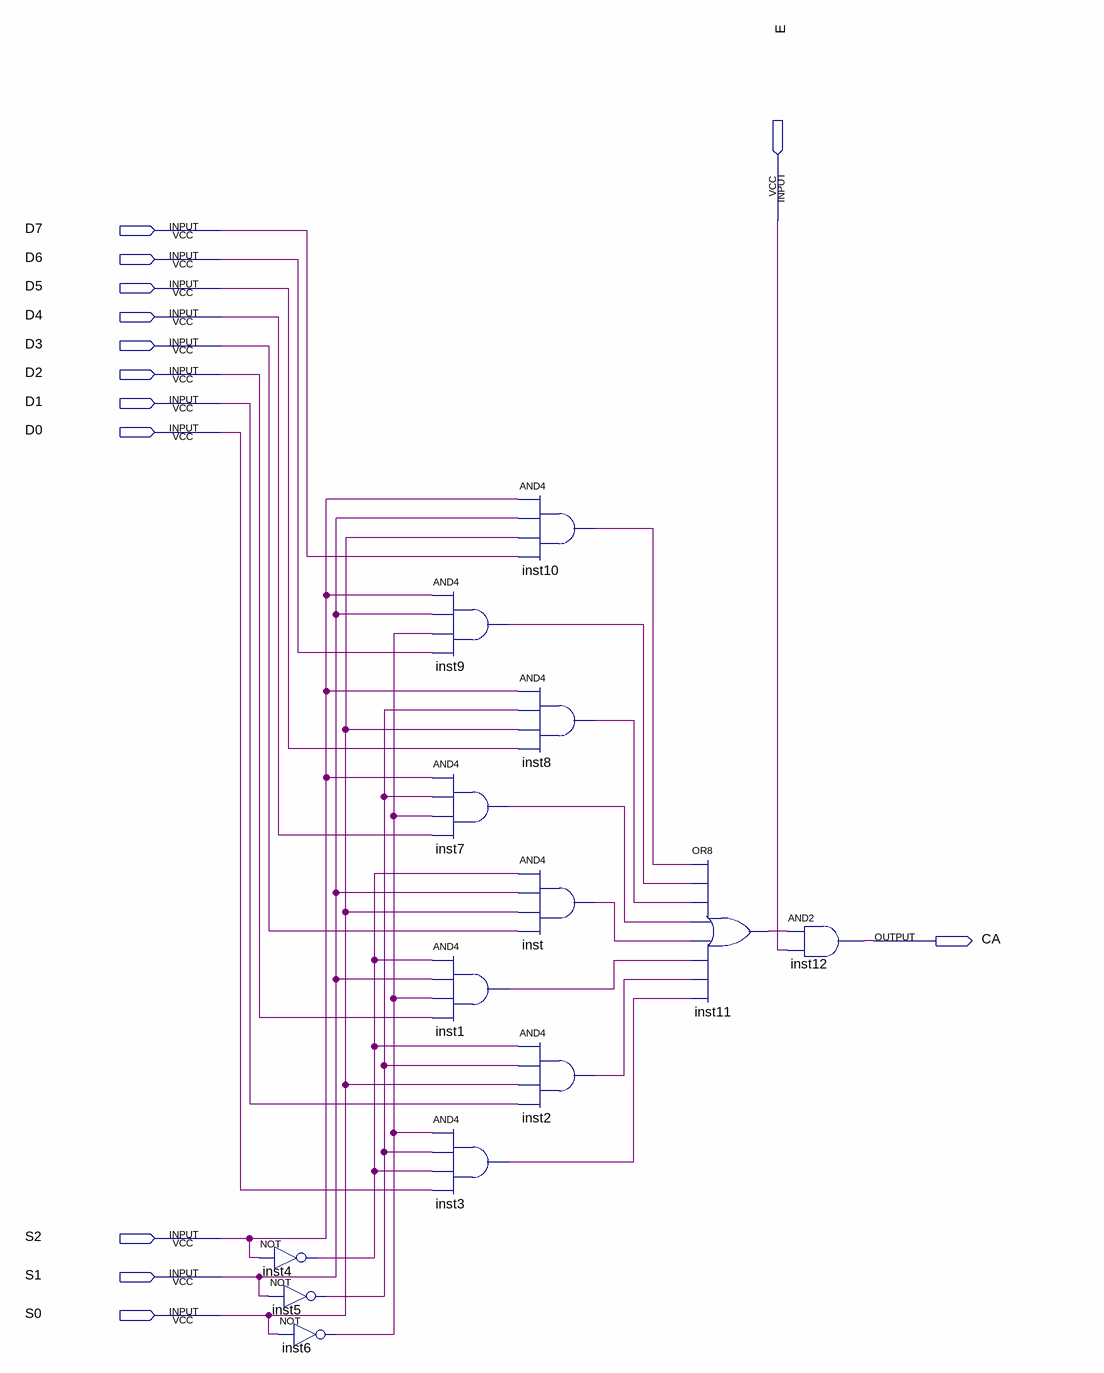
[diagram p0: schematic sheet]
// Quartus schematic EightOneMUX.bdf as structural Verilog: 13 symbols, 13 pins
module EightOneMUX (
  input  E,
  input  D7,
  input  D6,
  input  D5,
  input  D4,
  input  D3,
  input  D2,
  input  D1,
  input  D0,
  input  S2,
  input  S1,
  input  S0,
  output CA
);

  wire inst1_out, inst2_out, inst3_out, inst4_out, inst5_out, inst6_out, inst7_out, inst8_out, inst9_out,
       inst10_out, inst11_out, inst_out;

  not inst4 (inst4_out, S2);
  not inst5 (inst5_out, S1);
  not inst6 (inst6_out, S0);
  and inst9 (inst9_out, S2, S1, inst6_out, D6);
  and inst7 (inst7_out, S2, inst5_out, inst6_out, D4);
  and inst1 (inst1_out, inst4_out, S1, inst6_out, D2);
  and inst3 (inst3_out, inst6_out, inst5_out, inst4_out, D0);
  and inst10 (inst10_out, S2, S1, S0, D7);
  and inst8 (inst8_out, S2, inst5_out, S0, D5);
  and inst (inst_out, inst4_out, S1, S0, D3);
  and inst2 (inst2_out, inst4_out, inst5_out, S0, D1);
  or inst11 (inst11_out, inst10_out, inst9_out, inst8_out, inst7_out, inst_out, inst1_out, inst2_out, inst3_out);
  and inst12 (CA, inst11_out, E);
endmodule
